# EAGLE design radio-hat-v07 (EAGLE 9.7.0)
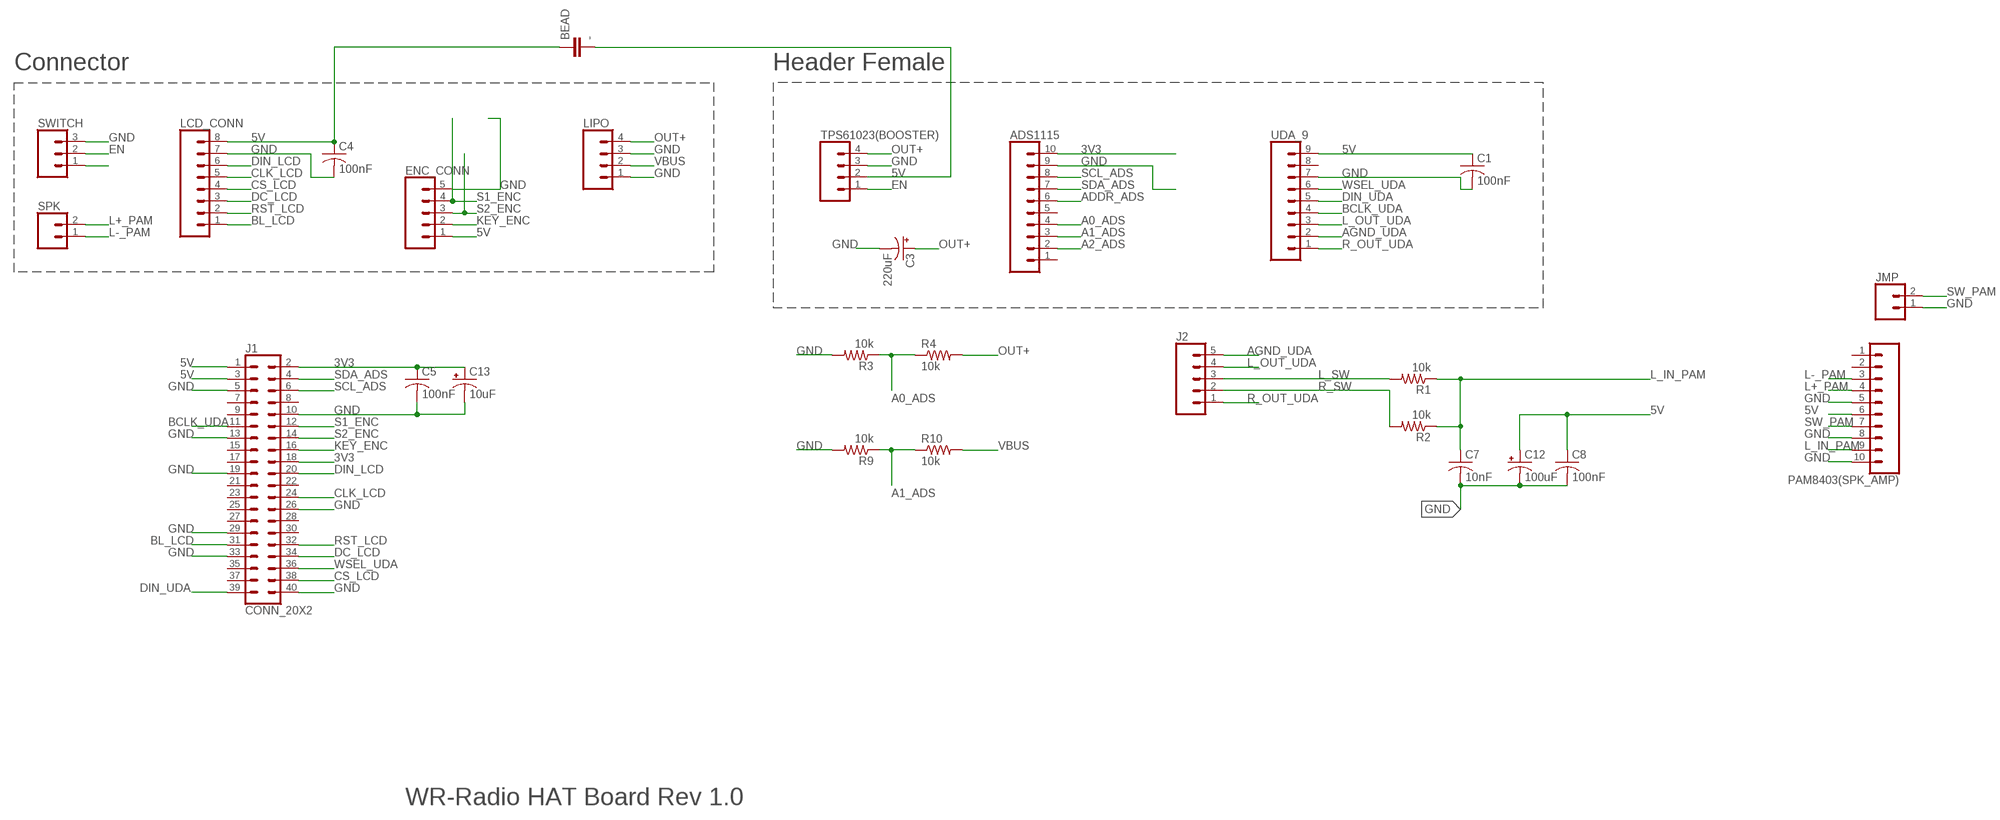
[diagram p0: schematic, sheet 1]

## Parts
ADS1115  CONN_10"  [1X10]
BEAD  -  10NF-PTH-10MM-10000V-1-%  [CAP-PTH-10MM]
C1  100nF  C-US050-024X044  [C050-024X044]
C3  220uF  100UF-POLAR-RADIAL-2.5MM-25V-20%  [CPOL-RADIAL-2.5MM-6.5MM]
C4  100nF  C-US050-024X044  [C050-024X044]
C5  100nF  C-US050-024X044  [C050-024X044]
C7  10nF  C-US050-024X044  [C050-024X044]
C8  100nF  C-US050-024X044  [C050-024X044]
C12  100uF  100UF-POLAR-RADIAL-2.5MM-25V-20%  [CPOL-RADIAL-2.5MM-6.5MM]
C13  10uF  100UF-POLAR-RADIAL-2.5MM-25V-20%  [CPOL-RADIAL-2.5MM-6.5MM]
ENC_CONN  CONN_05PTH  [1X05]
J1  CONN_20X2  [2X20]
J2  CONN_05PTH  [1X05]
JMP  CONN_02  [1X02]
LCD_CONN  CONN_08"  [1X08]
LIPO  CONN_04PTH  [1X04]
PAM8403(SPK_AMP)  CONN_102MM  [1X10-2MM]
R1  10k  R-US_0207/10  [0207/10]
R2  10k  R-US_0207/10  [0207/10]
R3  10k  R-US_0207/10  [0207/10]
R4  10k  R-US_0207/10  [0207/10]
R9  10k  R-US_0207/10  [0207/10]
R10  10k  R-US_0207/10  [0207/10]
SPK  CONN_02  [1X02]
SWITCH  CONN_03  [1X03]
TPS61023(BOOSTER)  CONN_04PTH  [1X04]
UDA_9  CONN_09  [1X09]

## Nets
3V3 [POWER]: ADS1115.10 C5.1 C13.1(+) J1.2 J1.18
5V [POWER]: BEAD.1 BEAD.2 C1.1 C4.1 C8.1 C12.1(+) ENC_CONN.1 J1.1 J1.3 LCD_CONN.8(VCC) PAM8403(SPK_AMP).6 TPS61023(BOOSTER).2 UDA_9.9
A0_ADS: ADS1115.4 R3.1 R4.1
A1_ADS: ADS1115.3 R9.1 R10.1
A2_ADS: ADS1115.2
ADDR_ADS: ADS1115.6
AGND_UDA: J2.5 UDA_9.2
BCLK_UDA: J1.11 UDA_9.4
BL_LCD: J1.31 LCD_CONN.1(BL)
CLK_LCD: J1.24 LCD_CONN.5(CLK)
CS_LCD: J1.38 LCD_CONN.4(CS)
DC_LCD: J1.34 LCD_CONN.3(DC)
DIN_LCD: J1.20 LCD_CONN.6(DIN)
DIN_UDA: J1.39 UDA_9.5
EN: SWITCH.2 TPS61023(BOOSTER).1
GND [POWER]: ADS1115.9 C1.2 C3.2(-) C4.2 C5.2 C7.2 C8.2 C12.2(-) C13.2(-) ENC_CONN.5 J1.5 J1.10 J1.13 J1.19 J1.26 J1.29 J1.33 J1.40 JMP.1 LCD_CONN.7(GND) LIPO.1 LIPO.3 PAM8403(SPK_AMP).5 PAM8403(SPK_AMP).8 PAM8403(SPK_AMP).10 R3.2 R9.2 SWITCH.3 TPS61023(BOOSTER).3 UDA_9.7
KEY_ENC: ENC_CONN.2 J1.16
L+_PAM: PAM8403(SPK_AMP).4 SPK.2
L-_PAM: PAM8403(SPK_AMP).3 SPK.1
L_IN_PAM: C7.1 PAM8403(SPK_AMP).9 R1.1 R2.1
L_OUT_UDA: J2.4 UDA_9.3
L_SW: J2.3 R1.2
N$2: SWITCH.1
OUT+: C3.1(+) LIPO.4 R4.2 TPS61023(BOOSTER).4
R_OUT_UDA: J2.1 UDA_9.1
R_SW: J2.2 R2.2
RST_LCD: J1.32 LCD_CONN.2(RST)
S1_ENC: ENC_CONN.4 J1.12
S2_ENC: ENC_CONN.3 J1.14
SCL_ADS: ADS1115.8 J1.6
SDA_ADS: ADS1115.7 J1.4
SW_PAM: JMP.2 PAM8403(SPK_AMP).7
VBUS: LIPO.2 R10.2
WSEL_UDA: J1.36 UDA_9.6
Unconnected: ADS1115.1 ADS1115.5 J1.7 J1.8 J1.9 J1.15 J1.17 J1.21 J1.22 J1.23 J1.25 J1.27 J1.28 J1.30 J1.35 J1.37 PAM8403(SPK_AMP).1 PAM8403(SPK_AMP).2 UDA_9.8

## Notes on the sheet
- Connector | Header Female
- WR-Radio HAT Board Rev 1.0

## Library data of the parts
ADS1115 = SparkFun-Connectors:CONN_10: Multi connection point. Often used as Generic Header-pin footprint for 0.1 inch spaced/style header connections On any of the 0.1 inch spaced packages, you can populate with these: Break Away Headers - Straight <https://www.sparkfun.com/products/116> (PRT-00116) Break Away Male Headers - Right Angle <https://www.sparkfun.com/products/553> (PRT-00553) Female Headers <https://www.sparkfun.com/products/115> (PRT-00115) Break Away Headers - Machine Pin <https://www.sparkfun.com/products/117> (PRT-00117) Break Away Female Headers - Swiss Machine Pin <https://www.sparkfun.com/products/743> (PRT-00743) Arduino Stackable Header - 10 Pin <https://www.sparkfun.com/products/11376> (PRT-11376) For SCREWTERMINALS and SPRING TERMINALS visit here: Screw Terimnals on SparkFun.com <https://www.sparkfun.com/search/results?term=Screw+Terminals> (5mm/3.5mm/2.54mm spacing) This device is also useful as a general connection point to wire up your design to another part of your project. Our various solder wires solder well into these plated through hole pads. Hook-Up Wire - Assortment (Stranded, 22 AWG) <https://www.sparkfun.com/products/11375> (PRT-11375) Hook-Up Wire - Assortment (Solid Core, 22 AWG) <https://www.sparkfun.com/products/11367> (PRT-11367) View the entire wire category on our website here <https://www.sparkfun.com/categories/141> Special notes: Molex polarized connector foot print use with SKU : PRT-08231 with associated crimp pins and housings. 1MM SMD Version SKU: PRT-10208 NOTES ON THE VARIANTS LOCK and LOCK_LONGPADS... This footprint was designed to help hold the alignment of a through-hole component (i.e. 6-pin header) while soldering it into place. You may notice that each hole has been shifted either up or down by 0.005 of an inch from it's more standard position (which is a perfectly straight line). This slight alteration caused the pins (the squares in the middle) to touch the edges of the holes. Because they are alternating, it causes a "brace" to hold the component in place. 0.005 has proven to be the perfect amount of "off-center" position when using our standard breakaway headers. Although looks a little odd when you look at the bare footprint, once you have a header in there, the alteration is very hard to notice. Also,if you push a header all the way into place, it is covered up entirely on the bottom side.; PROD_ID: CONN-11563
BEAD = SparkFun-Capacitors:10NF: 0.01uF/10nF/10,000pF ceramic capacitors A capacitor is a passive two-terminal electrical component used to store electrical energy temporarily in an electric field. CAP-09321; PROD_ID: CAP-09321; VALUE: 10nF
C1 C4 C5 C7 C8 = adafruit:C-US: CAPACITOR, American symbol
C3 C13 = SparkFun-Capacitors:100UF-POLAR: 100µF polarized capacitors A capacitor is a passive two-terminal electrical component used to store electrical energy temporarily in an electric field.; PROD_ID: CAP-08439; VALUE: 100uF
C12 = SparkFun-Capacitors:100UF-POLAR: 100µF polarized capacitors A capacitor is a passive two-terminal electrical component used to store electrical energy temporarily in an electric field.; PROD_ID: CAP-08439
ENC_CONN J2 = SparkFun-Connectors:CONN_05: Multi connection point. Often used as Generic Header-pin footprint for 0.1 inch spaced/style header connections On any of the 0.1 inch spaced packages, you can populate with these: Break Away Headers - Straight <https://www.sparkfun.com/products/116> (PRT-00116) Break Away Male Headers - Right Angle <https://www.sparkfun.com/products/553> (PRT-00553) Female Headers <https://www.sparkfun.com/products/115> (PRT-00115) Break Away Headers - Machine Pin <https://www.sparkfun.com/products/117> (PRT-00117) Break Away Female Headers - Swiss Machine Pin <https://www.sparkfun.com/products/743> (PRT-00743) For SCREWTERMINALS and SPRING TERMINALS visit here: Screw Terimnals on SparkFun.com <https://www.sparkfun.com/search/results?term=Screw+Terminals> (5mm/3.5mm/2.54mm spacing) This device is also useful as a general connection point to wire up your design to another part of your project. Our various solder wires solder well into these plated through hole pads. Hook-Up Wire - Assortment (Stranded, 22 AWG) <https://www.sparkfun.com/products/11375> (PRT-11375) Hook-Up Wire - Assortment (Solid Core, 22 AWG) <https://www.sparkfun.com/products/11367> (PRT-11367) View the entire wire category on our website here <https://www.sparkfun.com/categories/141> Special notes: Molex polarized connector foot print use with SKU : PRT-08231 with associated crimp pins and housings. 1MM SMD Version SKU: PRT-10208
J1 = SparkFun-Connectors:CONN_20X2: Multi connection point. Often used as Generic Header-pin footprint for 0.1 inch spaced/style header connections On any of the 0.1 inch spaced packages, you can populate with these: Break Away Headers - Straight <https://www.sparkfun.com/products/116> (PRT-00116) Break Away Male Headers - Right Angle <https://www.sparkfun.com/products/553> (PRT-00553) Female Headers <https://www.sparkfun.com/products/115> (PRT-00115) Break Away Headers - Machine Pin <https://www.sparkfun.com/products/117> (PRT-00117) Break Away Female Headers - Swiss Machine Pin <https://www.sparkfun.com/products/743> (PRT-00743)
JMP SPK = SparkFun-Connectors:CONN_02: Multi connection point. Often used as Generic Header-pin footprint for 0.1 inch spaced/style header connections On any of the 0.1 inch spaced packages, you can populate with these: Break Away Headers - Straight <https://www.sparkfun.com/products/116> (PRT-00116) Break Away Male Headers - Right Angle <https://www.sparkfun.com/products/553> (PRT-00553) Female Headers <https://www.sparkfun.com/products/115> (PRT-00115) Break Away Headers - Machine Pin <https://www.sparkfun.com/products/117> (PRT-00117) Break Away Female Headers - Swiss Machine Pin <https://www.sparkfun.com/products/743> (PRT-00743) For SCREWTERMINALS and SPRING TERMINALS visit here: Screw Terimnals on SparkFun.com <https://www.sparkfun.com/search/results?term=Screw+Terminals> (5mm/3.5mm/2.54mm spacing) This device is also useful as a general connection point to wire up your design to another part of your project. Our various solder wires solder well into these plated through hole pads. Hook-Up Wire - Assortment (Stranded, 22 AWG) <https://www.sparkfun.com/products/11375> (PRT-11375) Hook-Up Wire - Assortment (Solid Core, 22 AWG) <https://www.sparkfun.com/products/11367> (PRT-11367) View the entire wire category on our website here <https://www.sparkfun.com/categories/141> Special notes: Molex polarized connector foot print use with: PRT-08233 with associated crimp pins and housings. 2.54_SCREWTERM for use with PRT-10571. 3.5mm Screw Terminal footprints for PRT-08084 5mm Screw Terminal footprints for use with PRT-08432
LCD_CONN = SparkFun-Connectors-LCD:CONN_08: Multi connection point. Often used as Generic Header-pin footprint for 0.1 inch spaced/style header connections On any of the 0.1 inch spaced packages, you can populate with these: Break Away Headers - Straight <https://www.sparkfun.com/products/116> (PRT-00116) Break Away Male Headers - Right Angle <https://www.sparkfun.com/products/553> (PRT-00553) Female Headers <https://www.sparkfun.com/products/115> (PRT-00115) Break Away Headers - Machine Pin <https://www.sparkfun.com/products/117> (PRT-00117) Break Away Female Headers - Swiss Machine Pin <https://www.sparkfun.com/products/743> (PRT-00743) Arduino Stackable Header - 8 Pin <https://www.sparkfun.com/products/9279> (PRT-09279) For SCREWTERMINALS and SPRING TERMINALS visit here: Screw Terimnals on SparkFun.com <https://www.sparkfun.com/search/results?term=Screw+Terminals> (5mm/3.5mm/2.54mm spacing) This device is also useful as a general connection point to wire up your design to another part of your project. Our various solder wires solder well into these plated through hole pads. Hook-Up Wire - Assortment (Stranded, 22 AWG) <https://www.sparkfun.com/products/11375> (PRT-11375) Hook-Up Wire - Assortment (Solid Core, 22 AWG) <https://www.sparkfun.com/products/11367> (PRT-11367) View the entire wire category on our website here <https://www.sparkfun.com/categories/141> Special notes: Molex polarized connector foot print use with SKU : PRT-08231 with associated crimp pins and housings. 1MM SMD Version SKU: PRT-10208 NOTES ON THE VARIANTS LOCK and LOCK_LONGPADS... This footprint was designed to help hold the alignment of a through-hole component (i.e. 6-pin header) while soldering it into place. You may notice that each hole has been shifted either up or down by 0.005 of an inch from it's more standard position (which is a perfectly straight line). This slight alteration caused the pins (the squares in the middle) to touch the edges of the holes. Because they are alternating, it causes a "brace" to hold the component in place. 0.005 has proven to be the perfect amount of "off-center" position when using our standard breakaway headers. Although looks a little odd when you look at the bare footprint, once you have a header in there, the alteration is very hard to notice. Also,if you push a header all the way into place, it is covered up entirely on the bottom side.; PROD_ID: CONN-08438
LIPO TPS61023(BOOSTER) = SparkFun-Connectors:CONN_04: Multi connection point. Often used as Generic Header-pin footprint for 0.1 inch spaced/style header connections On any of the 0.1 inch spaced packages, you can populate with these: Break Away Headers - Straight <https://www.sparkfun.com/products/116> (PRT-00116) Break Away Male Headers - Right Angle <https://www.sparkfun.com/products/553> (PRT-00553) Female Headers <https://www.sparkfun.com/products/115> (PRT-00115) Break Away Headers - Machine Pin <https://www.sparkfun.com/products/117> (PRT-00117) Break Away Female Headers - Swiss Machine Pin <https://www.sparkfun.com/products/743> (PRT-00743) For SCREWTERMINALS and SPRING TERMINALS visit here: Screw Terimnals on SparkFun.com <https://www.sparkfun.com/search/results?term=Screw+Terminals> (5mm/3.5mm/2.54mm spacing) This device is also useful as a general connection point to wire up your design to another part of your project. Our various solder wires solder well into these plated through hole pads. Hook-Up Wire - Assortment (Stranded, 22 AWG) <https://www.sparkfun.com/products/11375> (PRT-11375) Hook-Up Wire - Assortment (Solid Core, 22 AWG) <https://www.sparkfun.com/products/11367> (PRT-11367) View the entire wire category on our website here <https://www.sparkfun.com/categories/141> Special notes: Molex polarized connector foot print use with SKU : PRT-08231 with associated crimp pins and housings. 1MM SMD Version SKU: PRT-10208; PROD_ID: CONN-09696
PAM8403(SPK_AMP) = SparkFun-Connectors:CONN_10: Multi connection point. Often used as Generic Header-pin footprint for 0.1 inch spaced/style header connections On any of the 0.1 inch spaced packages, you can populate with these: Break Away Headers - Straight <https://www.sparkfun.com/products/116> (PRT-00116) Break Away Male Headers - Right Angle <https://www.sparkfun.com/products/553> (PRT-00553) Female Headers <https://www.sparkfun.com/products/115> (PRT-00115) Break Away Headers - Machine Pin <https://www.sparkfun.com/products/117> (PRT-00117) Break Away Female Headers - Swiss Machine Pin <https://www.sparkfun.com/products/743> (PRT-00743) Arduino Stackable Header - 10 Pin <https://www.sparkfun.com/products/11376> (PRT-11376) For SCREWTERMINALS and SPRING TERMINALS visit here: Screw Terimnals on SparkFun.com <https://www.sparkfun.com/search/results?term=Screw+Terminals> (5mm/3.5mm/2.54mm spacing) This device is also useful as a general connection point to wire up your design to another part of your project. Our various solder wires solder well into these plated through hole pads. Hook-Up Wire - Assortment (Stranded, 22 AWG) <https://www.sparkfun.com/products/11375> (PRT-11375) Hook-Up Wire - Assortment (Solid Core, 22 AWG) <https://www.sparkfun.com/products/11367> (PRT-11367) View the entire wire category on our website here <https://www.sparkfun.com/categories/141> Special notes: Molex polarized connector foot print use with SKU : PRT-08231 with associated crimp pins and housings. 1MM SMD Version SKU: PRT-10208 NOTES ON THE VARIANTS LOCK and LOCK_LONGPADS... This footprint was designed to help hold the alignment of a through-hole component (i.e. 6-pin header) while soldering it into place. You may notice that each hole has been shifted either up or down by 0.005 of an inch from it's more standard position (which is a perfectly straight line). This slight alteration caused the pins (the squares in the middle) to touch the edges of the holes. Because they are alternating, it causes a "brace" to hold the component in place. 0.005 has proven to be the perfect amount of "off-center" position when using our standard breakaway headers. Although looks a little odd when you look at the bare footprint, once you have a header in there, the alteration is very hard to notice. Also,if you push a header all the way into place, it is covered up entirely on the bottom side.; PROD_ID: CONN-08875; SF_ID: PRT-08272
R1-R4 R9 R10 = adafruit:R-US_: RESISTOR, American symbol
SWITCH = SparkFun-Connectors:CONN_03: Multi connection point. Often used as Generic Header-pin footprint for 0.1 inch spaced/style header connections On any of the 0.1 inch spaced packages, you can populate with these: Break Away Headers - Straight <https://www.sparkfun.com/products/116> (PRT-00116) Break Away Male Headers - Right Angle <https://www.sparkfun.com/products/553> (PRT-00553) Female Headers <https://www.sparkfun.com/products/115> (PRT-00115) Break Away Headers - Machine Pin <https://www.sparkfun.com/products/117> (PRT-00117) Break Away Female Headers - Swiss Machine Pin <https://www.sparkfun.com/products/743> (PRT-00743) Stackable Header - 3 Pin (Female, 0.1") <https://www.sparkfun.com/products/13875> (PRT-13875) For SCREWTERMINALS and SPRING TERMINALS visit here: Screw Terimnals on SparkFun.com <https://www.sparkfun.com/search/results?term=Screw+Terminals> (5mm/3.5mm/2.54mm spacing) This device is also useful as a general connection point to wire up your design to another part of your project. Our various solder wires solder well into these plated through hole pads. Hook-Up Wire - Assortment (Stranded, 22 AWG) <https://www.sparkfun.com/products/11375> (PRT-11375) Hook-Up Wire - Assortment (Solid Core, 22 AWG) <https://www.sparkfun.com/products/11367> (PRT-11367) View the entire wire category on our website here <https://www.sparkfun.com/categories/141> Special notes: Molex polarized connector foot print use with SKU : PRT-08232 with associated crimp pins and housings.; PROD_ID: XXX-00000; VALUE: 455-1750-1-ND
UDA_9 = SparkFun-Connectors:CONN_09: Multi connection point. Often used as Generic Header-pin footprint for 0.1 inch spaced/style header connections On any of the 0.1 inch spaced packages, you can populate with these: Break Away Headers - Straight <https://www.sparkfun.com/products/116> (PRT-00116) Break Away Male Headers - Right Angle <https://www.sparkfun.com/products/553> (PRT-00553) Female Headers <https://www.sparkfun.com/products/115> (PRT-00115) Break Away Headers - Machine Pin <https://www.sparkfun.com/products/117> (PRT-00117) Break Away Female Headers - Swiss Machine Pin <https://www.sparkfun.com/products/743> (PRT-00743) For SCREWTERMINALS and SPRING TERMINALS visit here: Screw Terimnals on SparkFun.com <https://www.sparkfun.com/search/results?term=Screw+Terminals> (5mm/3.5mm/2.54mm spacing) This device is also useful as a general connection point to wire up your design to another part of your project. Our various solder wires solder well into these plated through hole pads. Hook-Up Wire - Assortment (Stranded, 22 AWG) <https://www.sparkfun.com/products/11375> (PRT-11375) Hook-Up Wire - Assortment (Solid Core, 22 AWG) <https://www.sparkfun.com/products/11367> (PRT-11367) View the entire wire category on our website here <https://www.sparkfun.com/categories/141> Special notes: Molex polarized connector foot print use with SKU : PRT-08231 with associated crimp pins and housings. 1MM SMD Version SKU: PRT-10208 NOTES ON THE VARIANTS LOCK and LOCK_LONGPADS... This footprint was designed to help hold the alignment of a through-hole component (i.e. 6-pin header) while soldering it into place. You may notice that each hole has been shifted either up or down by 0.005 of an inch from it's more standard position (which is a perfectly straight line). This slight alteration caused the pins (the squares in the middle) to touch the edges of the holes. Because they are alternating, it causes a "brace" to hold the component in place. 0.005 has proven to be the perfect amount of "off-center" position when using our standard breakaway headers. Although looks a little odd when you look at the bare footprint, once you have a header in there, the alteration is very hard to notice. Also,if you push a header all the way into place, it is covered up entirely on the bottom side.

## Board
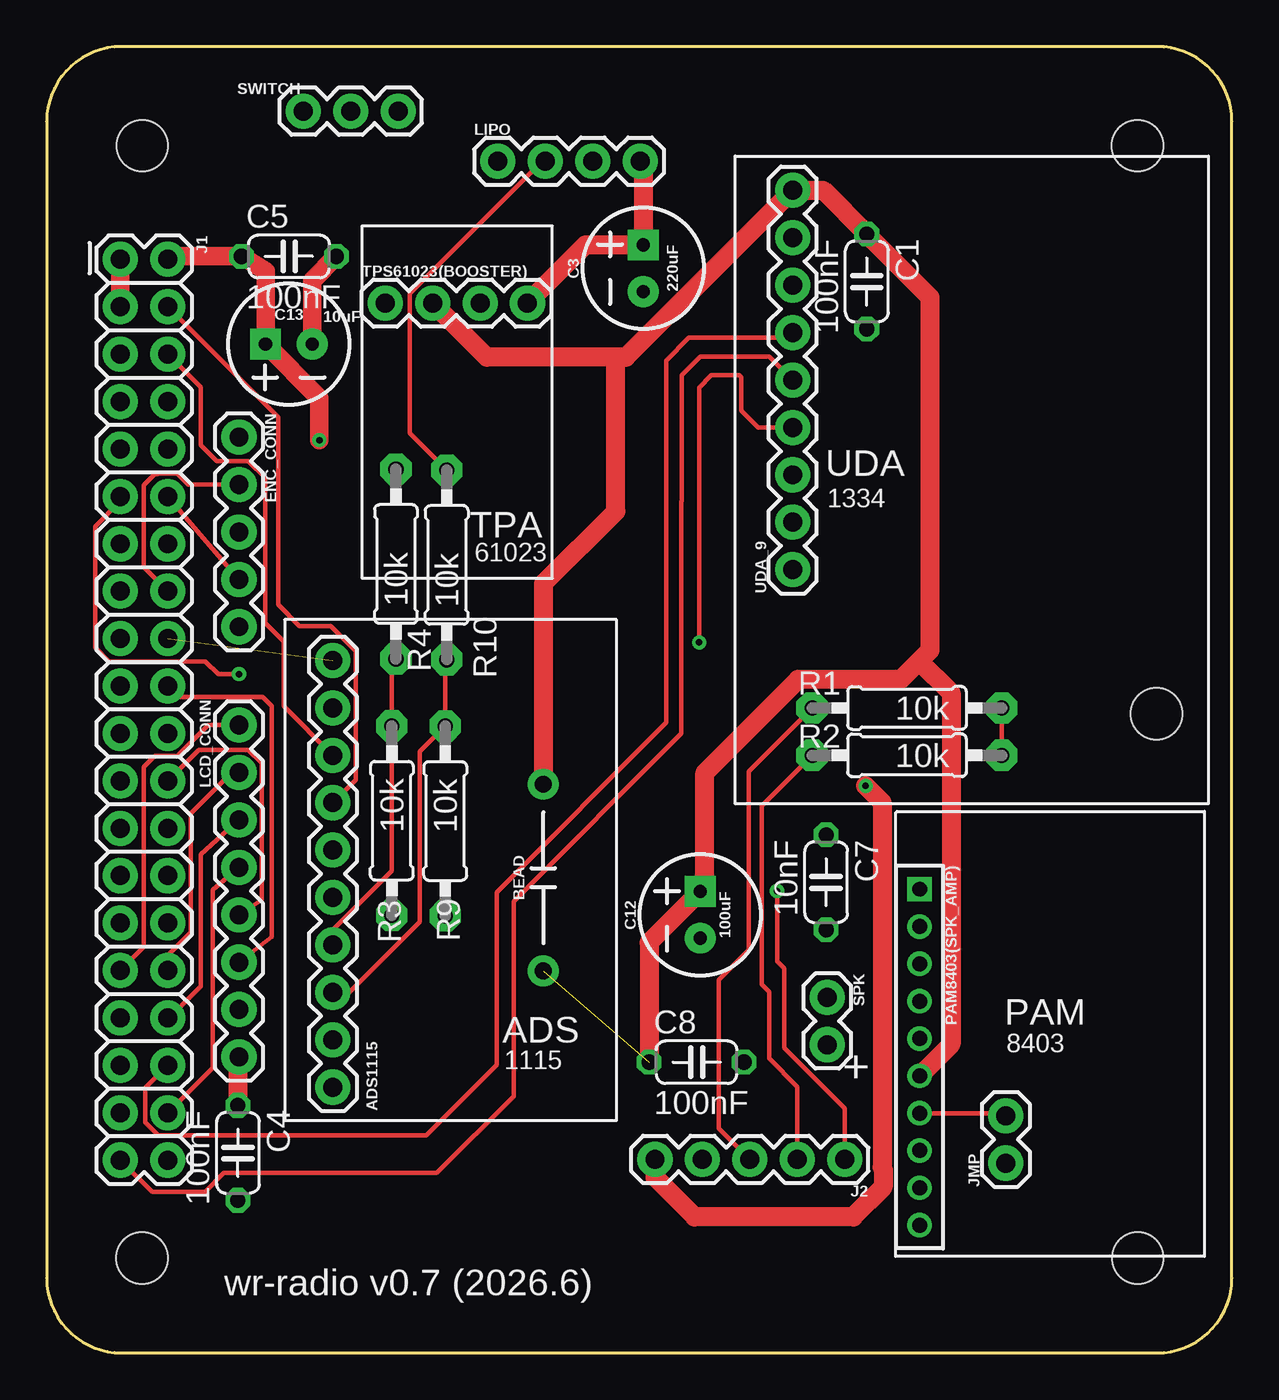
[diagram p1: board, top side]
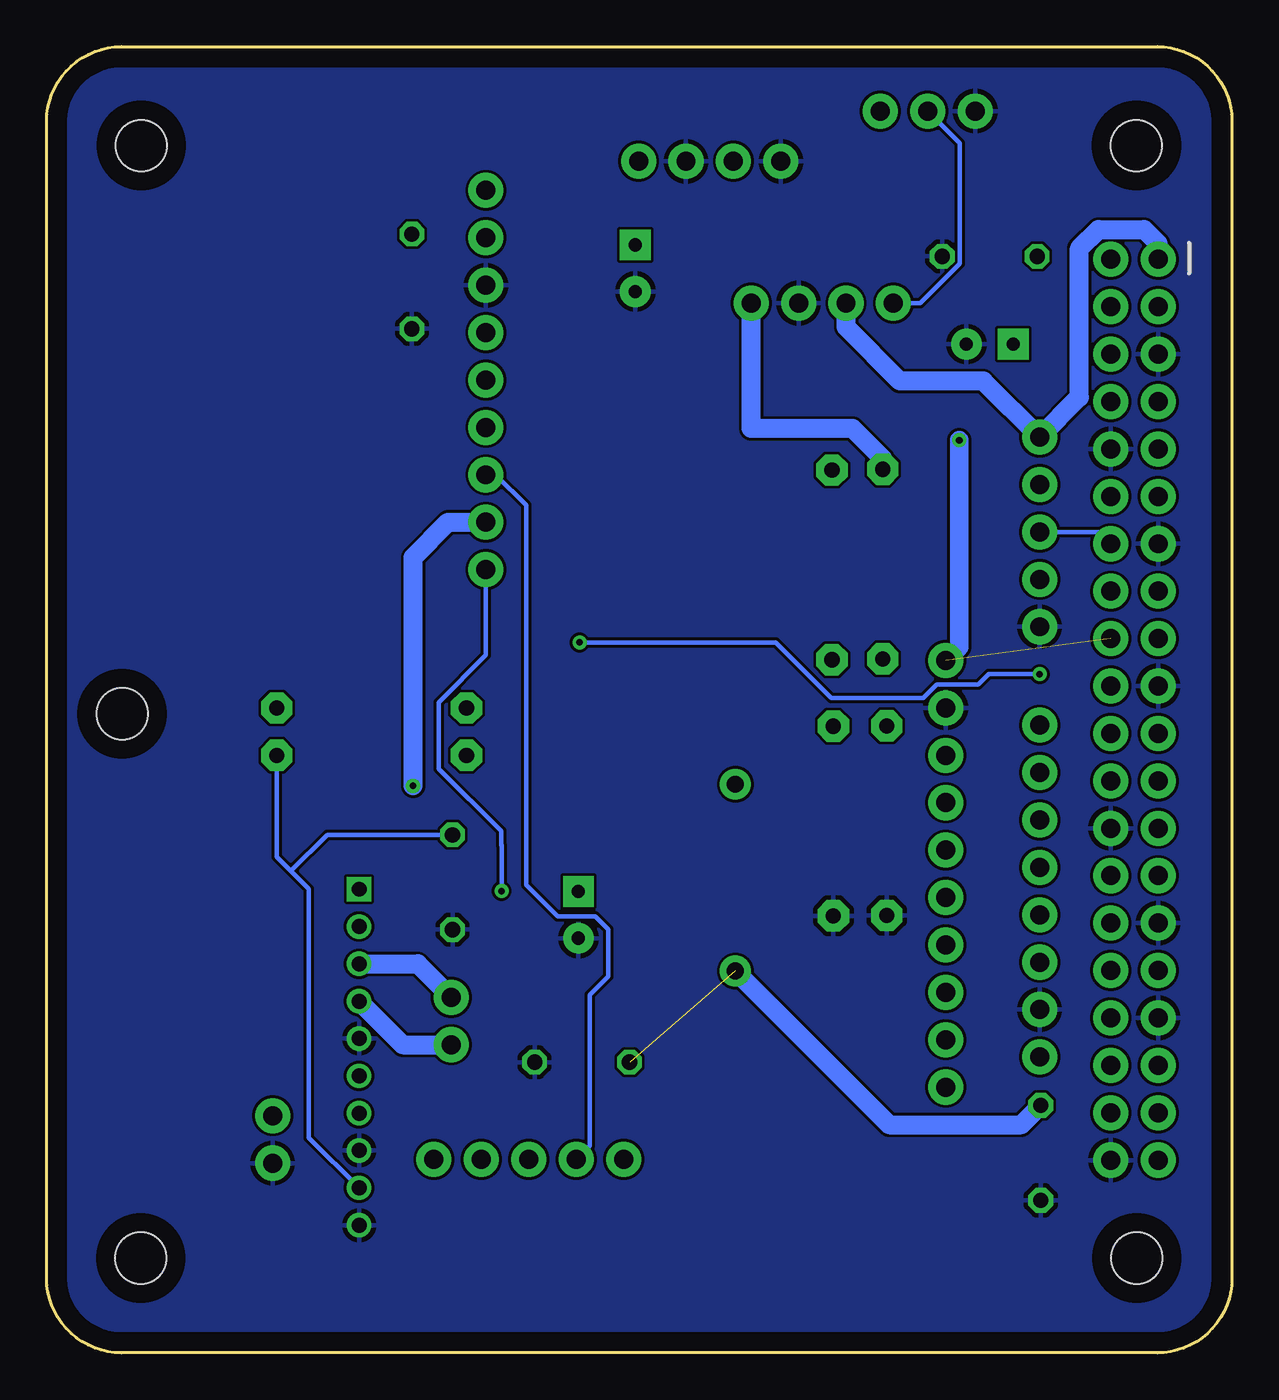
[diagram p2: board, bottom side, seen from below]

Size 63.48 x 69.98 mm. Coordinates in mm from the lower left corner, seen from the top.
Outline: 0,4 arc90 4,0 59.48,0 arc90 63.48,4 63.48,65.98 arc90 59.48,69.98 4,69.98 arc90 0,65.98 0,4
Copper layers (1*16): Top 0.035mm / dielectric 1.5mm / Bottom 0.035mm
Design rules "Fusion Electronics Design Rules": minimum track width 6mil, minimum drill 0.35mm, track to track 6mil, track to pad 6mil, pad to pad 6mil, via to via 6mil, smd to smd 6mil, copper to edge 40mil, drill to drill 6mil, minimum pad ring 10mil, minimum via ring 8mil, stop-mask expansion 4mil, vias tented up to drill 9999mil, thermal gap 10mil
Holes 2.75 mm at 59.44,34.24 5.1,5.08 5.12,64.68 58.42,64.68 58.44,5.08
tRestrict: area 36,43.9 to 37,51.9; area 36,35.1 to 37,43.3; area 36,27.8 to 37,35.1; area 30,22.6 to 31,27.1; area 30,12.6 to 31,22.6; area 30,5.8 to 31,12.6; area 30,27.1 to 37,28.1; area 36,54.8 to 36.9,63.6; area 36,43.1 to 37,43.9; area 36,61.2 to 36.9,70; area 30,0.5 to 31,7.3; area 2,1.9 to 8.3,8.2; 4 more areas

### Footprints (pad centres in the part's own frame; a part is rotated, then mirrored left to right if it is on the bottom)
1X10 = drill 1.016 pad 1.88: 1 0,0; 2 2.54,0; 3 5.08,0; 4 7.62,0; 5 10.16,0; 6 12.7,0; 7 15.24,0; 8 17.78,0; 9 20.32,0; 10 22.86,0
CAP-PTH-10MM = drill 0.9 pad 1.651: 1 -5,0; 2 5,0
C050-024X044 = drill 0.813 octagon: 1 -2.54,0; 2 2.54,0
CPOL-RADIAL-2.5MM-6.5MM = drill 0.7 pad 1.651 square: 1 1.25,0 | drill 0.7 pad 1.651: 2 -1.25,0
1X05 = drill 1.016 pad 1.88: 1 0,0; 2 2.54,0; 3 5.08,0; 4 7.62,0; 5 10.16,0
2X20 = drill 1.016 pad 1.88: 1 0,0; 2 0,2.54; 3 2.54,0; 4 2.54,2.54; 5 5.08,0; 6 5.08,2.54; 7 7.62,0; 8 7.62,2.54; 9 10.16,0; 10 10.16,2.54; 11 12.7,0; 12 12.7,2.54; 13 15.24,0; 14 15.24,2.54; 15 17.78,0; 16 17.78,2.54; 17 20.32,0; 18 20.32,2.54; 19 22.86,0; 20 22.86,2.54; 21 25.4,0; 22 25.4,2.54; 23 27.94,0; 24 27.94,2.54; 25 30.48,0; 26 30.48,2.54; 27 33.02,0; 28 33.02,2.54; 29 35.56,0; 30 35.56,2.54; 31 38.1,0; 32 38.1,2.54; 33 40.64,0; 34 40.64,2.54; 35 43.18,0; 36 43.18,2.54; 37 45.72,0; 38 45.72,2.54; 39 48.26,0; 40 48.26,2.54
1X02 = drill 1.016 pad 1.88: 1 0,0; 2 2.54,0
1X08 = drill 1.016 pad 1.88: 1 0,0; 2 2.54,0; 3 5.08,0; 4 7.62,0; 5 10.16,0; 6 12.7,0; 7 15.24,0; 8 17.78,0
1X04 = drill 1.016 pad 1.88: 1 0,0; 2 2.54,0; 3 5.08,0; 4 7.62,0
1X10-2MM = drill 0.8 square: 1 0,0 | drill 0.8: 2 2,0; 3 4,0; 4 6,0; 5 8,0; 6 10,0; 7 12,0; 8 14,0; 9 16,0; 10 18,0
0207/10 = drill 0.813 pad 1.676 octagon: 1 -5.08,0; 2 5.08,0
1X03 = drill 1.016 pad 1.88: 1 0,0; 2 2.54,0; 3 5.08,0
1X09 = drill 1.016 pad 1.88: 1 0,0; 2 2.54,0; 3 5.08,0; 4 7.62,0; 5 10.16,0; 6 12.7,0; 7 15.24,0; 8 17.78,0; 9 20.32,0

### Placement (x,y rotation side)
ADS1115  15.33,14.23 90 top
BEAD  26.6,25.46 90 top
C1  43.92,57.4 270 top
C3  31.95,58.11 90 top
C4  10.24,10.71 270 top
C5  12.97,58.74 0 top
C7  41.74,25.22 270 top
C8  34.8,15.57 0 top
C12  35,23.47 90 top
C13  12.97,54.04 180 top
ENC_CONN  10.3,49.06 270 top
J1  3.95,58.59 270 top
J2  42.74,10.36 180 top
JMP  51.38,10.16 90 top
LCD_CONN  10.3,33.63 270 top
LIPO  24.16,63.84 0 top
PAM8403(SPK_AMP)  46.75,24.84 270 top
R1  46.08,34.55 180 top
R2  46.08,32.01 180 top
R3  18.48,28.51 270 top
R4  18.7,42.26 90 top
R9  21.34,28.49 270 top
R10  21.43,42.21 90 top
SPK  41.81,19.05 270 top
SWITCH  18.83,66.52 180 top
TPS61023(BOOSTER)  18.13,56.24 0 top
UDA_9  39.95,41.96 90 top

### Tracks (layer width: path | path; a pad name or v marks a point on that pad's centre or on a via)
3V3  (via drill 0.35)  (1 unrouted)
  Top 1: J1.2 6.65,58.74 C5.1 11.72,57.95 C13.1 14.61,51.16 v14.61,48.89
  Bottom 1: v14.61,48.89 14.61,37.82 ADS1115.10
5V  (1 unrouted)
  Top 1: J1.3 J1.1
  Top 1.016: LCD_CONN.8 10.24,15.79 C4.1 | TPS61023(BOOSTER).2 23.57,53.34 30.11,53.34 30.48,53.34 | 30.48,53.34 31.02,53.34 UDA_9.9 41.58,62.28 C1.1 47.31,56.55 47.31,37.64 46.74,37.08 | BEAD.2 26.6,41.2 30.48,45.09 30.48,53.34 | 46.74,37.08 45.75,36.08 40.25,36.08 35.25,31.08 35.25,24.97 C12.1 32.27,21.98 C8.1 | 46.74,37.08 48.45,35.37 48.45,16.54 PAM8403(SPK_AMP).6
  Bottom 1.016: TPS61023(BOOSTER).2 20.67,54.96 17.78,52.07 13.31,52.07 ENC_CONN.1 8.17,51.19 8.17,59.17 7.15,60.18 4.71,60.18 3.95,59.43 J1.1 | BEAD.1 18.36,12.21 11.28,12.21 C4.1
A0_ADS
  Top 0.254: R4.1 18.48,36.96 R3.1 18.48,25.83 15.33,22.67 ADS1115.4
A1_ADS
  Top 0.254: R10.1 21.34,37.05 R9.1 19.98,32.21 19.98,23.09 16.21,19.31 ADS1115.3
AGND_UDA  (via drill 0.35)
  Top 1.016: v43.86,30.38 44.74,29.5 44.74,9.94 44.8,9.88 44.8,8.88 43.2,7.28 34.7,7.28 32.58,9.4 J2.5
  Bottom 1.016: v43.86,30.38 43.86,42.62 41.98,44.5 UDA_9.2
BCLK_UDA  (via drill 0.35)
  Top 0.254: v10.3,36.36 9.18,36.36 8.49,37.05 3.33,37.05 2.6,37.78 2.6,44.28 3.95,45.63 J1.11 | v34.94,38.06 34.94,51.72 35.6,52.38 37.1,52.38 37.2,52.28 37.2,50.48 38.1,49.58 UDA_9.4
  Bottom 0.254: v10.3,36.36 13.02,36.36 13.59,35.79 15.81,35.79 16.53,35.08 21.45,35.08 24.43,38.06 v34.94,38.06
BL_LCD
  Top 0.254: J1.31 5.2,21.73 5.2,31.38 5.79,31.97 7,31.97 8.66,33.63 LCD_CONN.1
CLK_LCD
  Top 0.254: LCD_CONN.5 11.43,24.2 11.52,24.29 11.52,31.59 10.8,32.31 8.15,32.31 J1.24
CS_LCD
  Top 0.254: LCD_CONN.4 8.89,24.81 8.89,15.27 J1.38
DC_LCD
  Top 0.254: LCD_CONN.3 8.26,26.71 8.26,19.63 6.57,17.95 J1.34
DIN_LCD
  Top 0.254: LCD_CONN.6 12.06,22.28 12.06,34.66 11.57,35.15 7.07,35.15 J1.20
DIN_UDA
  Top 0.254: UDA_9.5 38.7,53.38 35,53.38 34,52.38 34,45.62 34,33.18 25.01,24.19 25.01,13.75 20.89,9.63 9.49,9.63 8.48,8.63 5.65,8.63 J1.39
EN
  Bottom 0.254: SWITCH.2 14.57,64.81 14.57,58.36 16.69,56.24 TPS61023(BOOSTER).1
GND
  Top 1: C13.2 14.22,57.45 C5.2
  pour Bottom: -2.46,0.08 71.04,0.08 71.04,71.04 -2.46,71.04
KEY_ENC
  Top 0.254: J1.16 5.2,42.09 5.2,46.48 5.8,47.08 5.96,47.08 5.99,47.1 7,47.1 7.58,46.52 ENC_CONN.2
L+_PAM
  Bottom 1.016: PAM8403(SPK_AMP).4 44.42,16.51 SPK.2
L-_PAM
  Bottom 1.016: PAM8403(SPK_AMP).3 43.59,20.84 SPK.1
L_IN_PAM
  Top 0.254: R1.1 R2.1
  Bottom 0.254: PAM8403(SPK_AMP).9 49.44,11.53 49.44,24.84 50.09,25.51 50.4,25.8 | 50.4,25.8 51.16,26.56 R2.1 | C7.1 48.45,27.76 50.4,25.8
L_OUT_UDA
  Bottom 0.254: J2.4 34.4,11.08 34.4,19.18 33.4,20.18 33.4,22.68 34.1,23.38 36.1,23.38 37.8,25.08 37.8,45.41 39.42,47.04 UDA_9.3
L_SW
  Top 0.254: R1.2 37.6,31.16 37.6,21.58 36,19.98 36,12.02 J2.3
OUT+
  Top 1.016: TPS61023(BOOSTER).4 28.87,59.36 C3.1 31.95,63.67 LIPO.4
  Bottom 1.016: R4.2 18.7,47.91 20.32,49.53 25.75,49.53 TPS61023(BOOSTER).4
R_OUT_UDA  (via drill 0.35)
  Top 0.254: v39.12,24.74 39.12,20.97 39.49,20.59 39.49,16.34 42.74,13.1 J2.1
  Bottom 0.254: UDA_9.1 39.95,37.38 42.48,34.85 42.48,31.29 39.15,27.96 39.15,27.19 39.12,27.21 v39.12,24.74
R_SW
  Top 0.254: R2.2 38.3,29.31 38.3,19.73 38.69,19.33 38.69,15.76 40.2,14.26 J2.2
RST_LCD
  Top 0.254: J1.32 6.49,21.3 7.71,22.52 7.71,28.89 9.91,31.09 LCD_CONN.2
S1_ENC
  Top 0.254: ENC_CONN.4 J1.12
S2_ENC
  Bottom 0.254: J1.14 7.12,43.98 ENC_CONN.3
SCL_ADS
  Top 0.254: J1.6 8.26,51.74 8.26,48.62 9.1,47.78 10.8,47.78 11.7,46.88 11.7,39.1 12.7,38.1 12.7,34.65 ADS1115.8
SDA_ADS
  Top 0.254: J1.4 12.4,50.13 12.4,40.08 13.54,38.94 15.21,38.94 16.55,37.6 16.55,30.69 ADS1115.7
SW_PAM
  Top 0.254: PAM8403(SPK_AMP).7 51.24,12.84 JMP.2
VBUS
  Top 0.254: R10.2 19.45,49.27 19.45,56.74 26.55,63.84 LIPO.2
WSEL_UDA
  Top 0.254: UDA_9.6 39.67,54.38 34.4,54.38 33.19,53.17 33.19,33.77 24.1,24.68 24.1,15.43 20.32,11.65 5.99,11.65 5.27,12.36 5.27,14.19 J1.36

### Text on the board
tPlace: UDA | 1334 | TPA | 61023 | ADS | PAM | 8403 | 1115 | + | wr-radio v0.7 (2026.6)